# Altium schematic sheet 5-Accelerometer.SchDoc: Accessories
size A4; Organization: Unival Logistics; Address1: 550 S Hill St.; Address2: Suite 1607; Address3: Los Angeles, CA 90013; Revision: A; SheetNumber: 6; SheetTotal: 6
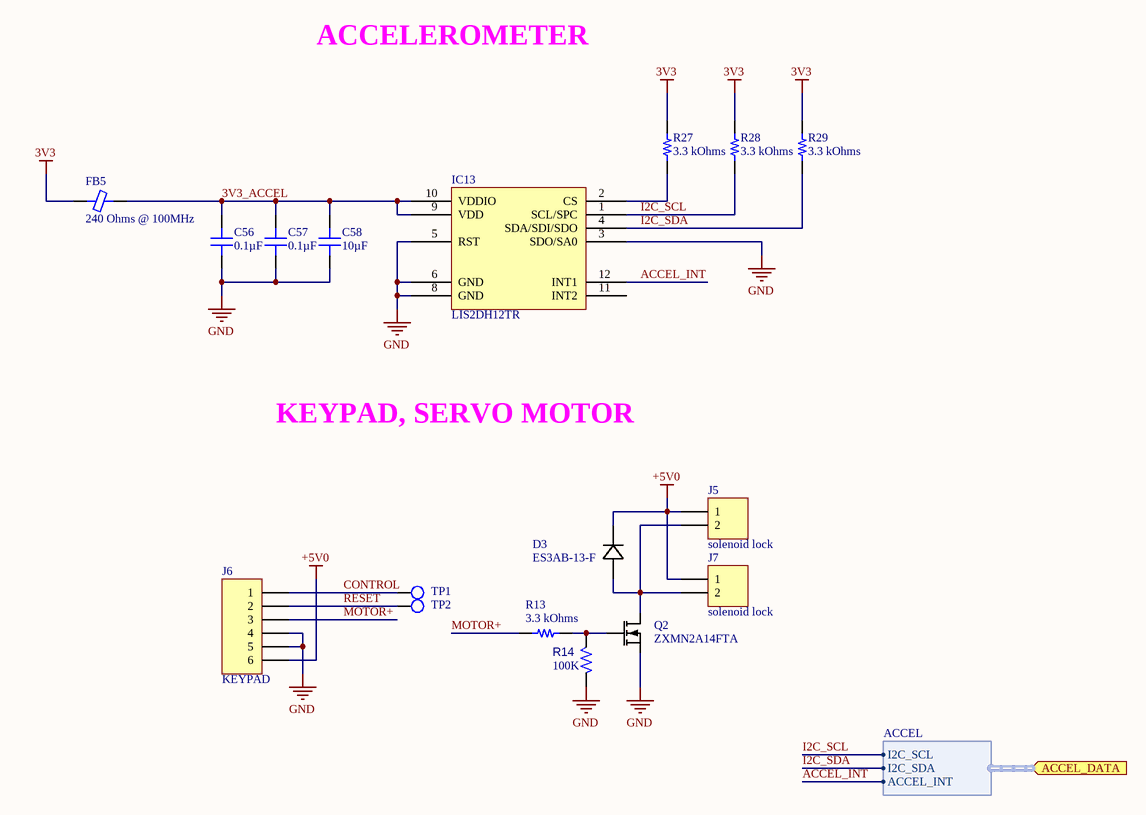
[diagram p0: 5-Accelerometer.SchDoc]

## Parts
C56  0.1µF  [CAP 0201_0603]
C57  0.1µF  [CAP 0201_0603]
C58  10µF  [CAP 0402_1005]
D3  ES3AB-13-F  [DIODE INC SMB]
FB5  240 Ohms @ 100MHz  [FER 0201_0603]
IC13  LIS2DH12TR  [ST LGA-12 2x2MM]
J5  solenoid lock  [MOLEX_282834-2]
J6  KEYPAD  [JST_B6B-PH-SM4-TB(LF)(SN)]
J7  solenoid lock  [MOLEX_282834-2]
Q2  ZXMN2A14FTA  [SOT-23]
R13  3.3 kOhms  [RES 0201_0603]
R14  100K  [RES 0201_0603]
R27  3.3 kOhms  [RES 0201_0603]
R28  3.3 kOhms  [RES 0201_0603]
R29  3.3 kOhms  [RES 0201_0603]
TP1  Test Point  [Test Point]  (value not drawn)  (no BOM)
TP2  Test Point  [Test Point]  (value not drawn)  (no BOM)

## Ports
ACCEL_DATA (in, harness ACCEL)

## Harnesses
ACCEL: I2C_SCL, I2C_SDA, ACCEL_INT

## Nets
3V3: FB5.1 R27.2 R28.2 R29.2
+5V0: D3.C J5.1 J6.6 J7.1
GND: C56.1 C57.1 C58.1 IC13.3(SDO/SA0) IC13.5(RST) IC13.6(GND) IC13.8(GND) J6.4 J6.5 Q2.2(S) R14.1
3V3_ACCEL: C56.2 C57.2 C58.2 FB5.2 IC13.9(VDD) IC13.10(VDDIO)
ACCEL_INT: IC13.12(INT1) ; port ACCEL_DATA.ACCEL_INT
CONTROL: J6.1 TP1.1(TP)
I2C_SCL: IC13.1(SCL/SPC) R28.1 ; port ACCEL_DATA.I2C_SCL
I2C_SDA: IC13.4(SDA/SDI/SDO) R29.1 ; port ACCEL_DATA.I2C_SDA
MOTOR+: J6.3 R13.2
RESET: J6.2 TP2.1(TP)
NetD3_A: D3.A J5.2 J7.2 Q2.3(D)
NetIC13_2: IC13.2(CS) R27.1
NetQ2_1: Q2.1(G) R13.1 R14.2

Not connected (* = marked no-connect by the designer): IC13 11(INT2)

## Notes on the sheet
- ACCELEROMETER
- KEYPAD, SERVO MOTOR
- Title
- Size:
- Date:
- A4
- Number:
- Time:
- Revision:
- Sheet
- of
- File:

## Library data of the parts
C56 C57 = Capacitor: CAP CER 0.1UF 16V X5R 0201; Part Number: GRM033R61C104ME84D; Manufacturer: Murata Electronics; Tolerance: ±20%; Value: 0.1µF; Applications: General Purpose; Capacitance: 0.1µF; ComponentLink1Description: Datasheet; ComponentLink1URL: https://search.murata.co.jp/Ceramy/image/img/A01X/G101/ENG/GRM033R61C104ME84-01.pdf; ComponentLink2Description: DigiKey Link; ComponentLink2URL: http://digikey.com/product-detail/en/murata-electronics/GRM033R61C104ME84D/490-9986-1-ND/5026291; Device Package: 0201 (0603 Metric); LastUpdated: 21/01/2020 00:00:12; Lifecycle Status: Active; Minimum Order: 1; Mounting Type: Surface Mount, MLCC; Operating Temperature: -55°C ~ 85°C; Package / Case: 0201 (0603 Metric); Packaging: TapeAndReel; PartId: 1522; Part Status: Active; Price: 0.01; Series: GRM; Size / Dimension: 0.024" L x 0.012" W (0.60mm x 0.30mm); Supplier 1: DigiKey; Supplier Part Number 1: 490-9986-1-ND; Temperature Coefficient: X5R; Thickness (Max): 0.013" (0.33mm); Voltage - Rated: 16V
C58 = Capacitor: CAP CER 10UF 6.3V X5R 0402; Part Number: GRM155R60J106ME15D; Manufacturer: Murata Electronics; Tolerance: ±20%; Value: 10µF; Applications: General Purpose; Capacitance: 10µF; ComponentLink1Description: Datasheet; ComponentLink1URL: https://www.murata.com/~/media/webrenewal/support/library/catalog/products/capacitor/mlcc/c02e.ashx?la=en-us; ComponentLink2Description: DigiKey Link; ComponentLink2URL: http://digikey.com/product-detail/en/murata-electronics/GRM155R60J106ME15D/490-13238-1-ND/5877446; Device Package: 0402 (1005 Metric); LastUpdated: 01/04/2020 23:56:51; Lifecycle Status: Active; Minimum Order: 1; Mounting Type: Surface Mount, MLCC; Operating Temperature: -55°C ~ 85°C; Package / Case: 0402 (1005 Metric); Packaging: TapeAndReel; PartId: 6754; Part Status: Active; Price: 0.03; Series: GRM; Size / Dimension: 0.039" L x 0.020" W (1.00mm x 0.50mm); Supplier 1: DigiKey; Supplier Part Number 1: 490-13238-1-ND; Temperature Coefficient: X5R; Thickness (Max): 0.026" (0.65mm); Voltage - Rated: 6.3V
D3 = 1N5819HW1-7-F: DIODE GEN PURP 50V 3A SMB; Manufacturer: Diodes Incorporated; Vendor: Comchip; Part Number: ES3AB-13-F; Digi-Key Part Number: ES3AB-FDITR-ND; Supplier: Digi-Key; Value: ES3AB-13-F
FB5 = Ferrite Chip: FERRITE BEAD 240 OHM 0201 1LN; Part Number: BK0603TS241-T; Manufacturer: Taiyo Yuden; Current Rating (Max): 400mA; DC Resistance (DCR) (Max): 320mOhm; Number of Lines: 1; ComponentLink1Description: Datasheet; ComponentLink1URL: https://ds.yuden.co.jp/TYCOMPAS/ut/detail?pn=BK0603TS241-T  &u=M; ComponentLink2Description: DigiKey Link; ComponentLink2URL: http://digikey.com/product-detail/en/taiyo-yuden/BK0603TS241-T/587-3276-1-ND/4157923; Device Package: 0201 (0603 Metric); Height (Max): 0.013" (0.33mm); Impedance @ Frequency: 240 Ohms @ 100MHz; LastUpdated: 21/01/2020 02:24:59; Lifecycle Status: Active; Minimum Order: 1; Mounting Type: Surface Mount; Operating Temperature: -55°C ~ 125°C; Package / Case: 0201 (0603 Metric); Packaging: TapeAndReel; PartId: 40; Part Status: Active; Price: 0.03; Series: BK; Size / Dimension: 0.024" L x 0.012" W (0.60mm x 0.30mm); Supplier 1: DigiKey; Supplier Part Number 1: 587-3276-1-ND; Value: 240 Ohms @ 100MHz
IC13 = ST LIS2DH12TR: ACCEL 2-16G I2C/SPI 12LGA; Manufacturer: STMicroelectronics; Acceleration Range: ±2g, 4g, 8g, 16g; Axis: X, Y, Z; Bandwidth: 0.5Hz ~ 672Hz; Output Type: I²C, SPI; Sensitivity (LSB/g): 1000 (±2g) ~ 83 (±16g); Voltage - Supply: 1.71V ~ 3.6V; Part Number: LIS2DH12TR; ComponentLink1Description: Datasheet; ComponentLink1URL: http://www.st.com/content/ccc/resource/technical/document/datasheet/12/c0/5c/36/b9/58/46/f2/DM00091513.pdf/files/DM00091513.pdf/jcr:content/translations/en.DM00091513.pdf; ComponentLink2Description: DigiKey Link; ComponentLink2URL: http://digikey.com/product-detail/en/stmicroelectronics/LIS2DH12TR/497-14851-1-ND/4899838; Device Package: 12-VFLGA; Features: Adjustable Bandwidth, Selectable Scale, Sleep Mode, Temperature Sensor; LastUpdated: 30/03/2020 15:41:11; Lifecycle Status: Active; Minimum Order: 1; Mounting Type: Surface Mount; Operating Temperature: -40°C ~ 85°C (TA); Package / Case: 12-VFLGA; Packaging: TapeAndReel; Part Status: Active; Price: 0.60; Series: -; Supplier 1: DigiKey; Supplier Part Number 1: 497-14851-1-ND; Supplier Device Package: 12-LGA (2x2); Type: Digital
J5 J7 = Header 2: TERM BLK 2P SIDE ENT 2.54MM PCB; Part Number: 282834-2; Manufacturer: TE Connectivity; Supplier Part Number 1: A98333-ND; Supplier 1: Digi-Key
J6 = Header 6: CONN HEADER SMD 6POS 2MM; Part Number: B6B-PH-SM4-TB(LF)(SN); Manufacturer: JST; Supplier Part Number 1: 455-1738-2-ND; Supplier 1: Digi-Key
Q2 = T:FET-N: MOSFET N-CH 20V 3.4A SOT23; Manufacturer: Diodes Incorporated; Part Number: ZXMN2A14FTA; Manufacturer Part Number: ZXMN2A14FTA; Value: ZXMN2A14FTA; Note: *; Supplier 1: Digi-Key; Supplier part number 1: ZXMN2A14FTR-ND
R13 R27-R29 = Resistor: RES SMD 3.3K OHM 1% 1/20W 0201; Part Number: ERJ-1GNF3301C; Manufacturer: Panasonic Electronic Components; Power (Watts): 0.05W, 1/20W; Temperature Coefficient: ±200ppm/°C; Value: 3.3 kOhms; ComponentLink1Description: Datasheet; ComponentLink1URL: https://industrial.panasonic.com/cdbs/www-data/pdf/RDA0000/AOA0000C304.pdf; ComponentLink2Description: DigiKey Link; ComponentLink2URL: http://digikey.com/product-detail/en/panasonic-electronic-components/ERJ-1GNF3301C/P122937CT-ND/8342813; Composition: Thick Film; Device Package: 0201 (0603 Metric); Features: Automotive AEC-Q200; Height - Seated (Max): 0.010" (0.26mm); LastUpdated: 21/01/2020 00:04:10; Lifecycle Status: Active; Minimum Order: 1; Number of Terminations: 2; Operating Temperature: -55°C ~ 125°C; Package / Case: 0201 (0603 Metric); Packaging: TapeAndReel; PartId: 4142; Part Status: Active; Price: 0.01; Ratings: AEC-Q200; Resistance: 3.3 kOhms; Series: ERJ; Size / Dimension: 0.024" L x 0.012" W (0.60mm x 0.30mm); Supplier 1: DigiKey; Supplier Part Number 1: P122937CT-ND; Supplier Device Package: 0201; Tolerance: ±1%
R14 = RSMT0626: RES 100K OHM 1% 1/20W 0201; Part Number: RMCF0201FT100K; Manufacturer: Stackpole Electronics Inc; Value: 100K; Supplier Part Number 1: RMCF0201FT100KTR-ND; ComponentLink1URL: https://chn-vm-apps.microchip.com/mchprepo/parts/Datasheets/AOA0000CE2.pdf; ComponentLink1Description: Datasheet; Supplier 1: Digi-Key